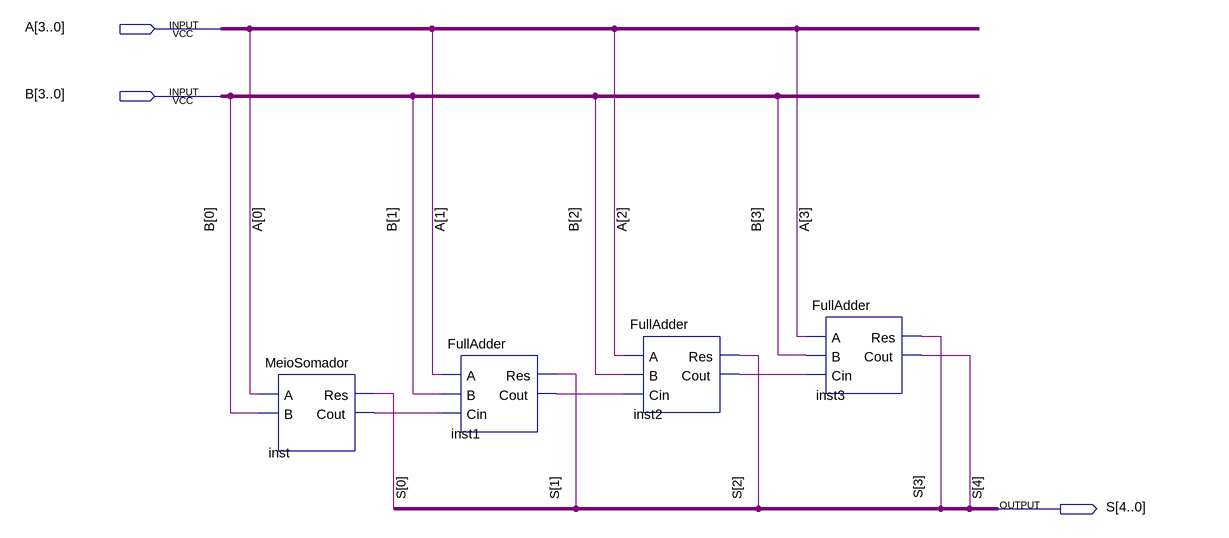
[diagram p0: schematic sheet]
// Quartus schematic Somador4Bits.bdf as structural Verilog: 4 symbols, 3 pins
module Somador4Bits (
  input  [3:0] A,
  input  [3:0] B,
  output [4:0] S
);

  wire inst1_cout, inst2_cout, inst_cout;

  MeioSomador inst (.A(A[0]), .B(B[0]), .Res(S[0]), .Cout(inst_cout));
  FullAdder inst1 (.A(A[1]), .B(B[1]), .Cin(inst_cout), .Res(S[1]), .Cout(inst1_cout));
  FullAdder inst2 (.A(A[2]), .B(B[2]), .Cin(inst1_cout), .Res(S[2]), .Cout(inst2_cout));
  FullAdder inst3 (.A(A[3]), .B(B[3]), .Cin(inst2_cout), .Res(S[3]), .Cout(S[4]));
endmodule
